# Altium schematic sheet Top_Sheet.SchDoc
size A4; SheetNumber: 1; SheetTotal: 3
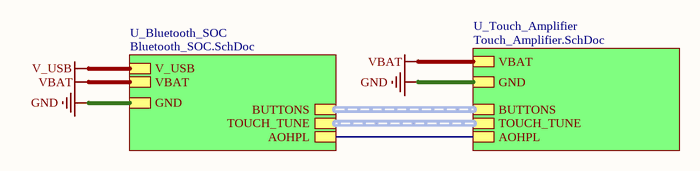
[diagram p0: Top_Sheet.SchDoc]

## Sub-sheets
U_Bluetooth_SOC = Bluetooth_SOC.SchDoc: BUTTONS (harness BUTTONS), TOUCH_TUNE (harness TOUCH_TUNE), GND, VBAT, V_USB, AOHPL
U_Touch_Amplifier = Touch_Amplifier.SchDoc: BUTTONS (harness BUTTONS), TOUCH_TUNE (harness TOUCH_TUNE), GND, VBAT, AOHPL

## Nets
GND: sheet U_Touch_Amplifier/GND, sheet U_Bluetooth_SOC/GND
V_USB: sheet U_Bluetooth_SOC/V_USB
VBAT: sheet U_Touch_Amplifier/VBAT, sheet U_Bluetooth_SOC/VBAT
(unnamed): sheet U_Touch_Amplifier/AOHPL, sheet U_Bluetooth_SOC/AOHPL

## Buses and harness runs
harness sheet U_Bluetooth_SOC/BUTTONS = sheet U_Touch_Amplifier/BUTTONS
harness sheet U_Bluetooth_SOC/TOUCH_TUNE = sheet U_Touch_Amplifier/TOUCH_TUNE

## Notes on the sheet
- File:
- Title:
- Date:
- Page
- Num:
- Total:
- Drawn By: Huzaifa Ali